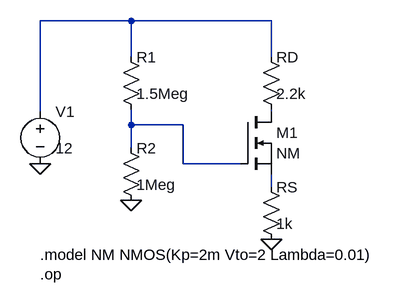
[diagram p0: schematic Ex08.asc]
Ex08.asc, the LTspice schematic file:
Version 4
SHEET 1 880 680
WIRE 60 200 60 60
WIRE 60 60 200 60
WIRE 200 60 200 116
WIRE 200 60 416 60
WIRE 416 60 416 116
WIRE 200 196 200 256
WIRE 200 220 280 220
WIRE 280 220 280 280
WIRE 280 280 368 280
WIRE 416 196 416 200
WIRE 416 296 416 316
FLAG 60 280 0
FLAG 200 336 0
FLAG 416 396 0
SYMBOL voltage 60 184 R0
WINDOW 0 24 16 Left 2
WINDOW 3 24 72 Left 2
SYMATTR InstName V1
SYMATTR Value 12
SYMBOL res 184 100 R0
WINDOW 0 24 16 Left 2
WINDOW 3 24 72 Left 2
SYMATTR InstName R1
SYMATTR Value 1.5Meg
SYMBOL res 184 240 R0
WINDOW 0 24 16 Left 2
WINDOW 3 24 72 Left 2
SYMATTR InstName R2
SYMATTR Value 1Meg
SYMBOL res 400 100 R0
WINDOW 0 24 16 Left 2
WINDOW 3 24 72 Left 2
SYMATTR InstName RD
SYMATTR Value 2.2k
SYMBOL nmos 368 200 R0
WINDOW 0 56 32 Left 2
WINDOW 3 56 64 Left 2
SYMATTR InstName M1
SYMATTR Value NM
SYMBOL res 400 300 R0
WINDOW 0 24 16 Left 2
WINDOW 3 24 72 Left 2
SYMATTR InstName RS
SYMATTR Value 1k
TEXT 60 420 Left 2 !.model NM NMOS(Kp=2m Vto=2 Lambda=0.01)
TEXT 60 450 Left 2 !.op

The netlist it stands for:
* Ex08.asc
V1 N001 0 12
R1 N001 N002 1.5Meg
R2 N002 0 1Meg
RD N001 N003 2.2k
M1 N003 N002 N004 N004 NM
RS N004 0 1k
.model NMOS NMOS
.model PMOS PMOS
.lib standard.mos
.model NM NMOS(Kp=2m Vto=2 Lambda=0.01)
.op
.backanno
.end